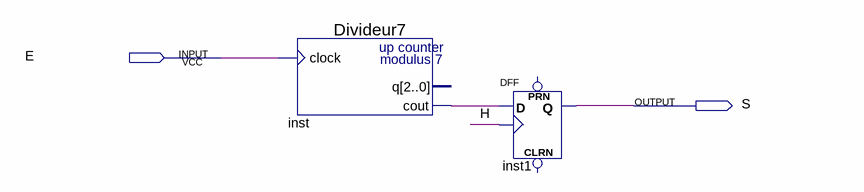
[diagram p0: schematic sheet]
// Quartus schematic Div7.bdf as structural Verilog: 2 symbols, 2 pins
module Div7 (
  input  E,
  output S
);

  wire H, inst_cout;

  Divideur7 inst (.clock(E), .cout(inst_cout));  // open: q
  DFF inst1 (.CLK(H), .D(inst_cout), .Q(S));  // open: CLRN, PRN
endmodule
